# Altium project adl5960-devboard.PrjPcb
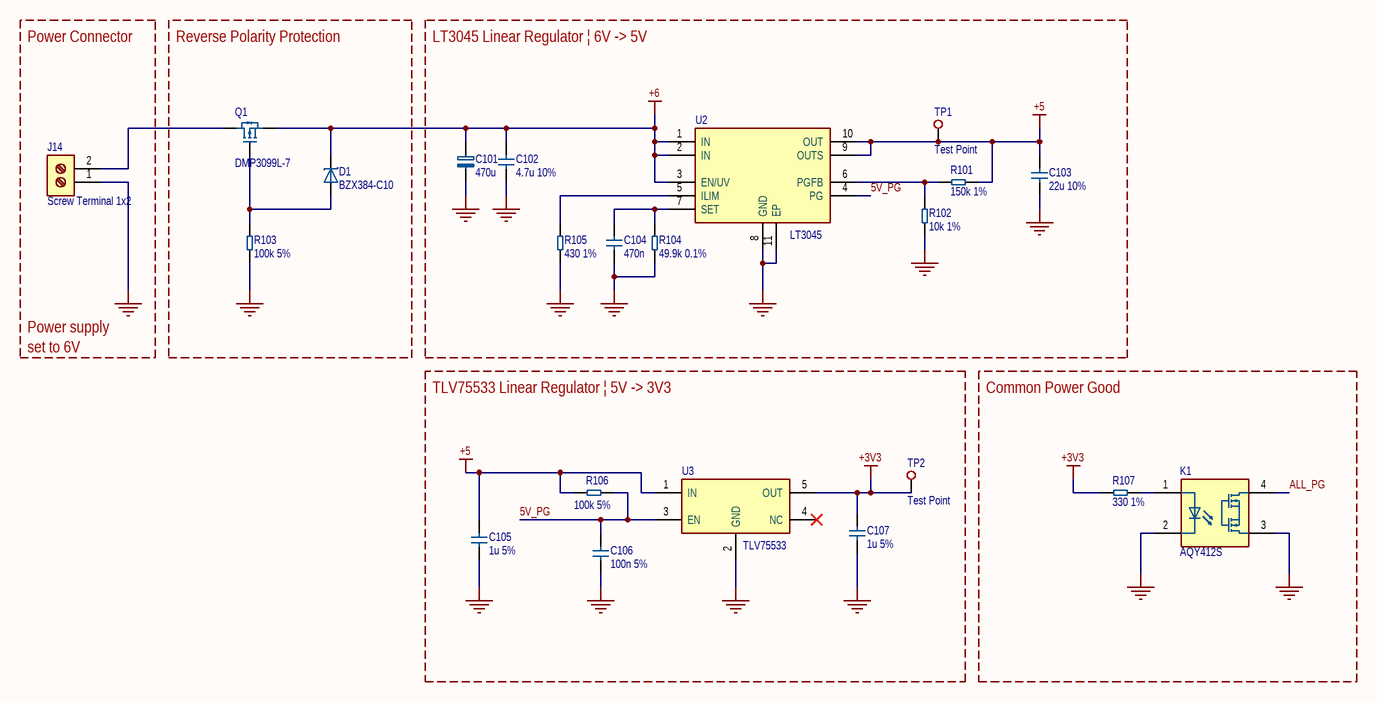
[diagram p0: adl5960-power.SchDoc]
Faculty: Wydział Elektroniki; Faculty2: i Technik Informacyjnych; ProjectAuthor: Piotr Pokornowski; ProjectCode: PP-5960DEV; ProjectRevision: A; ProjectSupervisor: Dr Inż. Maciej Urbański; ProjectTitle: ADL5960 Evalboard; ThesisType: Praca magisterska; University: Politechnika Warszawska
2 sheets, 73 parts. Net scope: global (net labels, ports and power ports of the same name join across sheets).
Board file: adl5960-devboard.PcbDoc
Sheets:
  adl5960-power.SchDoc
  adl5960-main.SchDoc

## Sheet adl5960-power.SchDoc: Zasilanie
size 420 x 297 mm; SheetNumber: 1; SheetTotal: 2; DocumentType: Schemat elektryczny

### Parts
C101  470u  [cap-ae-d10-h12.4-av]
C102  4.7u 10%  [c-0805]
C103  22u 10%  [c-1210]
C104  470n  [c-0805]
C105  1u 5%  [c-0805]
C106  100n 5%  [c-0603]
C107  1u 5%  [c-0805]
D1  BZX384-C10  [sod-323]
J14  Screw Terminal 1x2  [1715721]
K1  AQY412S  [sop-4]
Q1  DMP3099L-7  [sot-23-3-p0.95]
R101  150k 1%  [r-0603]
R102  10k 1%  [r-0603]
R103  100k 5%  [r-0603]
R104  49.9k 0.1%  [r-0603]
R105  430 1%  [r-0603]
R106  100k 5%  [r-0603]
R107  330 1%  [r-0603]
TP1  Test Point  [tp-keystone-5015]
TP2  Test Point  [tp-keystone-5015]
U2  LT3045  [LT3045HDD]
U3  TLV75533  [sot-23-5-p0.95]

### Blocks framed on the sheet
Reverse Polarity Protection: D1 Q1 R103
LT3045 Linear Regulator | 6V -> 5V: C101-C104 R101 R102 R104 R105 TP1 U2
TLV75533 Linear Regulator | 5V -> 3V3: C105-C107 R106 TP2 U3
Common Power Good: K1 R107

### Nets
+3V3: C107.2 R107.2 TP2.1 U3.5(OUT)
+5: C103.2 C105.2 R101.1 R106.2 TP1.1 U2.9(OUTS) U2.10(OUT) U3.1(IN)
+6: C101.1 C102.2 D1.1 Q1.2(S) U2.1(IN) U2.2(IN) U2.3(EN/UV)
GND: C101.2 C102.1 C103.1 C104.1 C105.1 C106.1 C107.1 J14.1 K1.2(Cathode) K1.3(Drain) R102.2 R103.1 R104.1 R105.1 U2.8(GND) U2.11(EP) U3.2(GND)
5V_PG: C106.2 R106.1 U2.4(PG) U3.3(EN)
ALL_PG: K1.4(Drain)
NetC104_2: C104.2 R104.2 U2.7(SET)
NetD1_2: D1.2 Q1.1(G) R103.2
NetJ14_2: J14.2 Q1.3(D)
NetK1_1: K1.1(Anode) R107.1
NetR101_2: R101.2 R102.1 U2.6(PGFB)
NetR105_2: R105.2 U2.5(ILIM)

Not connected (* = marked no-connect by the designer): U3 4(NC)*

### Notes on the sheet
- Power Connector
- Power supply
- set to 6V
- 1
- 2
- 3
- 4
- 5
- 6
- 7
- 8
- A
- B
- C
- D
- E
- Uczelnia
- Projekt
- Autor
- Typ dokumentu
- Promotor
- F
- Tytuł arkusza
- Numer dokumentu
- -
- Rew.
- Data
- Arkusz
- /

### Library data of the parts
C101 = Capacitor-Polar: Polarized capacitor; Manufacturer: KEMET; Manufacturer Part Number: A786MS477M1ELAV012; Voltage Rating: 25V; Tolerance: 20%; Value: 470u
C102 = Capacitor: Generic non-polarized capacitor; Manufacturer: KEMET; Manufacturer Part Number: C0805C475K4RACTU; Voltage Rating: 16V; Dielectric: X7R; Value: 4.7u; Tolerance: 10%
C103 = Capacitor: Generic non-polarized capacitor; Manufacturer: KEMET; Manufacturer Part Number: C1210C226K4RACTU; Voltage Rating: 16V; Dielectric: X7R; Value: 22u; Tolerance: 10%
C104 = Capacitor: Generic non-polarized capacitor; Manufacturer: KEMET; Manufacturer Part Number: C0805C474J4RACAUTO; Voltage Rating: 16V; Tolerance: 5%; Dielectric: X7R; Value: 470n
C105 C107 = Capacitor: Generic non-polarized capacitor; Manufacturer: KEMET; Manufacturer Part Number: C0805C105J4RAC7210; Voltage Rating: 16V; Dielectric: X7R; Value: 1u; Tolerance: 5%
C106 = Capacitor: Generic non-polarized capacitor; Manufacturer: KEMET; Manufacturer Part Number: C0603C104J4RACTU; Voltage Rating: 16V; Dielectric: X7R; Value: 100n; Tolerance: 5%
D1 = BZX384-C10,115: Diode Zener Single 10V 5% 300mW 2-Pin SOD-323 T/R; Manufacturer: Nexperia; Manufacturer Lifecycle Status: RELEASED FOR SUPPLY; Collector Emitter Breakdown Voltage: 32V; Collector Emitter Saturation Voltage: -300mV; ESD Protection: No; hFE Min: 215; Impedance: 20Ω; Max Collector Current: 100mA; Max Reverse Leakage Current: 200nA; Number of Elements: 1; Polarity: Unidirectional; Reverse Standoff Voltage: 7V; Test Current: 5mA; Supplier: RS; Supplier Part Number: 1787095; Manufacturer Part Number: BZX384-C10,115; RoHS: Compliant; Category: Zener Diodes; Stock: 23400; Case/Package: SC; China RoHS: Compliant; Composition: Zener; Contact Plating: Tin; Country of Origin: Mainland China; Export Control Classification Number (ECCN) Code: EAR99; Element Configuration: Single; Height: 1.05mm; Harmonized Tariff Schedule (HTS) Code: 8541.10.00.50; Introduction Date: 2004-03-23; Lead Free: Lead Free; Length: 1.8mm; Lifecycle Status: Production; Max Operating Temperature: 150°C; Max Power Dissipation: 300mW; Min Operating Temperature: -65°C; Mounting Technology: Surface Mount; Pins: 2; Number of Terminals: 2; Peak Reverse Current: 200nA; Power Dissipation: 300mW; Radiation Hardening: No; Ratings: AEC-Q101; REACH SVHC: Unaffected; Reference Voltage: 10V; Schedule B: 8541100050, 8541100050|8541100050|8541100050|8541100050|8541100050; Termination: SMD/SMT; Tolerance: 5%; Voltage Tolerance: 5%; Weight: 4.535924g; Width: 1.35mm; Zener Current: 5mA; Zener Voltage: 10V; ComponentLink1URL: https://datasheet.octopart.com:443/BZX384-C10%2C115-Nexperia-datasheet-8360268.pdf?src-supplier=IHS; ComponentLink1Description: https://datasheet.octopart.com:443/BZX384-C10%2C115-Nexperia-datasheet-8360268.pdf?src-supplier=IHS; ComponentLink2URL: https://datasheet.octopart.com:443/BZX384-C10%2C115-Nexperia-datasheet-155662751.pdf?src-supplier=Newark; ComponentLink2Description: https://datasheet.octopart.com:443/BZX384-C10%2C115-Nexperia-datasheet-155662751.pdf?src-supplier=Newark; ComponentLink3URL: https://datasheet.octopart.com:443/BZX384-C10%2C115-NXP-Semiconductors-datasheet-10052903.pdf?src-supplier=Newark; ComponentLink3Description: https://datasheet.octopart.com:443/BZX384-C10%2C115-NXP-Semiconductors-datasheet-10052903.pdf?src-supplier=Newark; ComponentLink4URL: https://datasheet.octopart.com:443/BZX384-C10%2C115-Nexperia-datasheet-79471522.pdf?src-supplier=LKR; ComponentLink4Description: https://datasheet.octopart.com:443/BZX384-C10%2C115-Nexperia-datasheet-79471522.pdf?src-supplier=LKR; ComponentLink5URL: https://datasheet.octopart.com:443/BZX384-C10%2C115-Nexperia-datasheet-68321567.pdf?src-supplier=element14+APAC; ComponentLink5Description: https://datasheet.octopart.com:443/BZX384-C10%2C115-Nexperia-datasheet-68321567.pdf?src-supplier=element14+APAC; ComponentLink6URL: https://datasheet.octopart.com:443/BZX384-C10%2C115-Nexperia-datasheet-105678879.pdf?src-supplier=TME; ComponentLink6Description: https://datasheet.octopart.com:443/BZX384-C10%2C115-Nexperia-datasheet-105678879.pdf?src-supplier=TME; ComponentLink7URL: https://datasheet.octopart.com:443/BZX384-C10%2C115-Nexperia-datasheet-194695641.pdf?src-supplier=HQonline; ComponentLink7Description: https://datasheet.octopart.com:443/BZX384-C10%2C115-Nexperia-datasheet-194695641.pdf?src-supplier=HQonline; ComponentLink8URL: http://sigma.octopart.com:80/reach_statement/NXP-Semiconductors-company-13.pdf?src-supplier=Compliance+Statements; ComponentLink8Description: http://sigma.octopart.com:80/reach_statement/NXP-Semiconductors-company-13.pdf?src-supplier=Compliance+Statements; ComponentLink9URL: http://sigma.octopart.com:80/rohs_statement/NXP-Semiconductors-company-12.pdf?src-supplier=Compliance+Statements; ComponentLink9Description: http://sigma.octopart.com:80/rohs_statement/NXP-Semiconductors-company-12.pdf?src-supplier=Compliance+Statements
J14 = Screw-Terminal-01x02: Terminal Block; 17.5 A; 250 V; 5.08 mm; 26 to 14 AWG; 2; Screw; Solder; 4 kV; Manufacturer: Phoenix Contact; Manufacturer Lifecycle Status: AVAILABLE; Approvals: CSA, cUL; Connector Type: PCB, Screw, Terminal Block; Current: 15A; Current Rating: 17.5A; Max Current Rating: 22A; Max Supply Voltage: 250V; Number of Circuits: 2; Number of Levels: 1; Pitch: 5.08mm; Stripping Length: 7mm; Test Voltage: 4kV; Voltage: 300V; Voltage Rating: 400V; Wire/Cable Gauge: 14AWG; Wire Gauge (Max): 26AWG; Supplier: RS; Supplier Part Number: 1930564; Manufacturer Part Number: 1715721; RoHS: Compliant; Category: Terminal Blocks; Stock: 3745; China RoHS: Compliant; Color: Green; Contact Material: Tin; Country of Origin: Germany; Depth: 9.8mm; Export Control Classification Number (ECCN) Code: EAR99; Flammability Rating: UL94 V-0; Height: 17.3mm; Housing Color: Green; Harmonized Tariff Schedule (HTS) Code: 8536.90.40.00; Insulation Material: Nylon; Introduction Date: 1998-01-15; Lead Free: Lead Free; Lead Pitch: 5.08mm; Length: 10.16mm; Lifecycle Status: Production; Max Operating Temperature: 105°C; Min Operating Temperature: -40°C; Mounting Technology: Screw; Number of Contacts: 2; Pins: 2; Number of Poles: 2; Number of Positions: 2; Number of Positions Per Level: 2; Number of Rows: 1; Orientation: Straight; Packaging: Box; Radiation Hardening: No; REACH SVHC: Unaffected; Termination: Screw; Voltage Rating (AC): 250V; Weight: 2.939987g; Width: 17.3mm; Wire Gauge (Min): 26AWG; ComponentLink1URL: https://datasheet.octopart.com:443/1715721-Phoenix-Contact-datasheet-195288929.pdf?src-supplier=Phoenix+Contact; ComponentLink1Description: https://datasheet.octopart.com:443/1715721-Phoenix-Contact-datasheet-195288929.pdf?src-supplier=Phoenix+Contact; ComponentLink2URL: https://sigma.octopart.com:443/195221700/technical_drawing/Phoenix-Contact-1715721.pdf?src-supplier=Phoenix+Contact; ComponentLink2Description: https://sigma.octopart.com:443/195221700/technical_drawing/Phoenix-Contact-1715721.pdf?src-supplier=Phoenix+Contact; ComponentLink3URL: https://datasheet.octopart.com:443/1715721-Phoenix-Contact-datasheet-62122377.pdf?src-supplier=Upverter; ComponentLink3Description: https://datasheet.octopart.com:443/1715721-Phoenix-Contact-datasheet-62122377.pdf?src-supplier=Upverter; ComponentLink4URL: https://datasheet.octopart.com:443/1715721-Phoenix-Contact-datasheet-181073212.pdf?src-supplier=IHS; ComponentLink4Description: https://datasheet.octopart.com:443/1715721-Phoenix-Contact-datasheet-181073212.pdf?src-supplier=IHS; ComponentLink5URL: https://datasheet.octopart.com:443/1715721-Phoenix-Contact-datasheet-66579234.pdf?src-supplier=Master+Electronics; ComponentLink5Description: https://datasheet.octopart.com:443/1715721-Phoenix-Contact-datasheet-66579234.pdf?src-supplier=Master+Electronics; ComponentLink6URL: https://datasheet.octopart.com:443/1715721-Phoenix-Contact-datasheet-14715205.pdf?src-supplier=Newark; ComponentLink6Description: https://datasheet.octopart.com:443/1715721-Phoenix-Contact-datasheet-14715205.pdf?src-supplier=Newark; ComponentLink7URL: https://datasheet.octopart.com:443/1715721-Phoenix-Contact-datasheet-499485.pdf?src-supplier=Newark; ComponentLink7Description: https://datasheet.octopart.com:443/1715721-Phoenix-Contact-datasheet-499485.pdf?src-supplier=Newark; ComponentLink8URL: https://datasheet.octopart.com:443/1715721-Phoenix-Contact-datasheet-154778360.pdf?src-supplier=Electro+Sonic; ComponentLink8Description: https://datasheet.octopart.com:443/1715721-Phoenix-Contact-datasheet-154778360.pdf?src-supplier=Electro+Sonic; ComponentLink9URL: https://datasheet.octopart.com:443/1715721-Phoenix-Contact-datasheet-9792235.pdf?src-supplier=TodayComponents; ComponentLink9Description: https://datasheet.octopart.com:443/1715721-Phoenix-Contact-datasheet-9792235.pdf?src-supplier=TodayComponents; ComponentLink10URL: https://datasheet.octopart.com:443/1715721-Phoenix-Contact-datasheet-166145896.pdf?src-supplier=Burklin+Elektronik; ComponentLink10Description: https://datasheet.octopart.com:443/1715721-Phoenix-Contact-datasheet-166145896.pdf?src-supplier=Burklin+Elektronik; ComponentLink11URL: https://datasheet.octopart.com:443/1715721-Phoenix-Contact-datasheet-33452854.pdf?src-supplier=MRO+Stop; ComponentLink11Description: https://datasheet.octopart.com:443/1715721-Phoenix-Contact-datasheet-33452854.pdf?src-supplier=MRO+Stop; ComponentLink12URL: https://datasheet.octopart.com:443/1715721-Phoenix-Contact-datasheet-8332660.pdf?src-supplier=Future+Electronics; ComponentLink12Description: https://datasheet.octopart.com:443/1715721-Phoenix-Contact-datasheet-8332660.pdf?src-supplier=Future+Electronics; ComponentLink13URL: https://datasheet.octopart.com:443/1715721-Phoenix-Contact-datasheet-19322.pdf?src-supplier=RS+(Formerly+Allied+Electronics); ComponentLink13Description: https://datasheet.octopart.com:443/1715721-Phoenix-Contact-datasheet-19322.pdf?src-supplier=RS+(Formerly+Allied+Electronics); ComponentLink14URL: https://datasheet.octopart.com:443/1715721-Phoenix-Contact-datasheet-84424.pdf?src-supplier=DigiKey; ComponentLink14Description: https://datasheet.octopart.com:443/1715721-Phoenix-Contact-datasheet-84424.pdf?src-supplier=DigiKey; ComponentLink15URL: http://sigma.octopart.com:80/195206437/materials_sheet/Phoenix-Contact-1715721.pdf?src-supplier=Compliance+Statements; ComponentLink15Description: http://sigma.octopart.com:80/195206437/materials_sheet/Phoenix-Contact-1715721.pdf?src-supplier=Compliance+Statements
K1 = AQY412S: RELAY OPTO 60V 0.5A SOP4 / Solid State Relay 50mA 1.5V DC-IN 0.5A 60V AC/DC-OUT 4-Pin SOP Tube; Manufacturer: Panasonic; Manufacturer Lifecycle Status: ACTIVE; Approvals: VDE, cULus; Contact Resistance: 1Ω; Current Rating: 500mA; Data Polarity: AC/DC; Forward Current: 5mA; Input Current: 900µA; Isolation Voltage: 1500Vrms; Number of Elements: 1; On-State Resistance: 2.5Ω; Value: 2.5Ω; Test Voltage: 1.5kV; Throw Configuration: SPST; Supplier: Farnell; Supplier Part Number: AQY412S; Manufacturer Part Number: AQY412S; RoHS: Compliant; Category: Solid State Relays; Stock: 46; Case/Package: SOP; Contact Plating: Tin Bismuth; Country of Origin: Japan; Export Control Classification Number (ECCN) Code: EAR99; Height: 2.1mm; Harmonized Tariff Schedule (HTS) Code: 8541.40.95.00; Introduction Date: 2005-10-06; Lead Free: Lead Free; Length: 4.4mm; Lifecycle Status: Production; Load Current: 500mA; Max Input Current: 50mA; Max Length: 4.4mm; Max Operating Temperature: 85°C; Max Output current: 500mA; Max Output Voltage: 60V; Min Operating Temperature: -40°C; Mounting Technology: Surface Mount; Pins: 4; Output Current: 500mA; Output Voltage: 60V; Packaging: Box; Radiation Hardening: No; REACH SVHC: Unaffected; Relay Type: Relay; Termination: Gull Wing; Width: 4.3mm; ComponentLink1URL: https://datasheet.octopart.com:443/AQY412S-Panasonic-datasheet-101746478.pdf?src-supplier=IHS; ComponentLink1Description: https://datasheet.octopart.com:443/AQY412S-Panasonic-datasheet-101746478.pdf?src-supplier=IHS; ComponentLink2URL: https://datasheet.octopart.com:443/AQY412S-Panasonic-datasheet-109899.pdf?src-supplier=Future+Electronics; ComponentLink2Description: https://datasheet.octopart.com:443/AQY412S-Panasonic-datasheet-109899.pdf?src-supplier=Future+Electronics; ComponentLink3URL: https://datasheet.octopart.com:443/AQY412S-Panasonic-datasheet-11045713.pdf?src-supplier=Future+Electronics; ComponentLink3Description: https://datasheet.octopart.com:443/AQY412S-Panasonic-datasheet-11045713.pdf?src-supplier=Future+Electronics; ComponentLink4URL: https://datasheet.octopart.com:443/AQY412S-Panasonic-datasheet-31679424.pdf?src-supplier=Electro+Sonic; ComponentLink4Description: https://datasheet.octopart.com:443/AQY412S-Panasonic-datasheet-31679424.pdf?src-supplier=Electro+Sonic; ComponentLink5URL: https://datasheet.octopart.com:443/AQY412S-Panasonic-datasheet-26528092.pdf?src-supplier=Electro+Sonic; ComponentLink5Description: https://datasheet.octopart.com:443/AQY412S-Panasonic-datasheet-26528092.pdf?src-supplier=Electro+Sonic; ComponentLink6URL: https://datasheet.octopart.com:443/AQY412S-Panasonic-datasheet-8857770.pdf?src-supplier=element14; ComponentLink6Description: https://datasheet.octopart.com:443/AQY412S-Panasonic-datasheet-8857770.pdf?src-supplier=element14; ComponentLink7URL: https://datasheet.octopart.com:443/AQY412S-Panasonic-datasheet-12514924.pdf?src-supplier=element14; ComponentLink7Description: https://datasheet.octopart.com:443/AQY412S-Panasonic-datasheet-12514924.pdf?src-supplier=element14; ComponentLink8URL: https://datasheet.octopart.com:443/AQY412S-Panasonic-datasheet-57363625.pdf?src-supplier=element14+APAC; ComponentLink8Description: https://datasheet.octopart.com:443/AQY412S-Panasonic-datasheet-57363625.pdf?src-supplier=element14+APAC; ComponentLink9URL: https://datasheet.octopart.com:443/AQY412S-Panasonic-datasheet-142674666.pdf?src-supplier=Master+Electronics; ComponentLink9Description: https://datasheet.octopart.com:443/AQY412S-Panasonic-datasheet-142674666.pdf?src-supplier=Master+Electronics; ComponentLink10URL: https://datasheet.octopart.com:443/AQY412S-Panasonic-datasheet-9700424.pdf?src-supplier=RS+(Formerly+Allied+Electronics); ComponentLink10Description: https://datasheet.octopart.com:443/AQY412S-Panasonic-datasheet-9700424.pdf?src-supplier=RS+(Formerly+Allied+Electronics); ComponentLink11URL: https://datasheet.octopart.com:443/AQY412S-Panasonic-datasheet-14176184.pdf?src-supplier=iiiC; ComponentLink11Description: https://datasheet.octopart.com:443/AQY412S-Panasonic-datasheet-14176184.pdf?src-supplier=iiiC
Q1 = DMP3099L-7: Transistor, MOSFET, P-Channel, 30V, 3.8A, 1.08W, SOT-23, SMD; Manufacturer: Diodes Inc.; Drain to Source Breakdown Voltage: -30V; Drain to Source Resistance: 65mΩ; Element Configuration: Single; Fall Time: 15ns; Gate to Source Voltage (Vgs): 20V; Input Capacitance: 563pF; Max Junction Temperature (Tj): 150°C; Number of Channels: 1; Rise Time: 5ns; Threshold Voltage: -2.1V; Turn-Off Delay Time: 31ns; Turn-On Delay Time: 4.8ns; Supplier: RS; Supplier Part Number: 8270503P; Manufacturer Part Number: DMP3099L-7; RoHS: Compliant; Category: MOSFETs; Stock: 444300; Case/Package: SOT-23; China RoHS: Compliant; Contact Plating: Tin; Continuous Drain Current (ID): 3.8A; Country of Origin: Mainland China; Drain to Source Voltage (Vds): -30V; Export Control Classification Number (ECCN) Code: EAR99; Height: 1.1mm; Introduction Date: 2013-05-28; Lead Free: Lead Free; Length: 3mm; Lifecycle Status: Production; Max Operating Temperature: 150°C; Max Power Dissipation: 1.08W; Min Breakdown Voltage: 30V; Min Operating Temperature: -55°C; Mounting Technology: Surface Mount; Number of Elements: 1; Pins: 3; Number of Terminals: 3; Power Dissipation: 1.08W; Radiation Hardening: No; Ratings: AEC-Q101; Rds On Max: 65mΩ; REACH SVHC: Unaffected; Schedule B: 8541290080, 8541290080|8541290080|8541290080|8541290080|8541290080; Weight: 7.994566mg; Width: 1.4mm; ComponentLink1URL: https://datasheet.octopart.com:443/DMP3099L-7-Diodes-Inc.-datasheet-171818965.pdf?src-supplier=Newark; ComponentLink1Description: https://datasheet.octopart.com:443/DMP3099L-7-Diodes-Inc.-datasheet-171818965.pdf?src-supplier=Newark; ComponentLink2URL: https://datasheet.octopart.com:443/DMP3099L-7-Diodes-Inc.-datasheet-17559051.pdf?src-supplier=Newark; ComponentLink2Description: https://datasheet.octopart.com:443/DMP3099L-7-Diodes-Inc.-datasheet-17559051.pdf?src-supplier=Newark; ComponentLink3URL: https://sigma.octopart.com:443/138706058/technical_drawing/Diodes-Inc.-DMP3099L-7.pdf?src-supplier=Diodes+Inc+SCT; ComponentLink3Description: https://sigma.octopart.com:443/138706058/technical_drawing/Diodes-Inc.-DMP3099L-7.pdf?src-supplier=Diodes+Inc+SCT
R101 = Resistor: Generic resistor; Manufacturer: YAGEO; Manufacturer Part Number: AC0603FR-07150KL; Power Rating: 100mW; Value: 150k; Tolerance: 1%
R102 = Resistor: Generic resistor; Manufacturer: YAGEO; Manufacturer Part Number: AC0603FRE0710KL; Power Rating: 100mW; Value: 10k; Tolerance: 1%
R103 R106 = Resistor: Generic resistor; Manufacturer: YAGEO; Manufacturer Part Number: AC0603JR-07100KL; Power Rating: 100mW; Value: 100k; Tolerance: 5%
R104 = Resistor: Generic resistor; Manufacturer: YAGEO; Manufacturer Part Number: AT0603BRD0749K9L; Power Rating: 100mW; Value: 49.9k; Tolerance: 0.1%
R105 = Resistor: Generic resistor; Manufacturer: YAGEO; Manufacturer Part Number: AC0603FR-07430RL; Value: 430; Power Rating: 100mW; Tolerance: 1%
R107 = Resistor: Generic resistor; Manufacturer: YAGEO; Manufacturer Part Number: AC0603FR-07330RL; Value: 330; Power Rating: 100mW; Tolerance: 1%
TP1 TP2 = TestPoint
U2 = LT3045HDD: Manufacturer: Analog Devices; Manufacturer Lifecycle Status: PRODUCTION; Manufacturer Part Number: LT3045HDD#TRPBF; Case/Package: DFN; Category: LDO Voltage Regulators; Lifecycle Status: Production; Pins: 10; RoHS: Compliant
U3 = TLV75533PDBVR: 500mA high-PSRR low-IQ low-dropout voltage regulator with enable 5-SOT-23 -40 to 125; Manufacturer: Texas Instruments; Manufacturer Lifecycle Status: ACTIVE; Accuracy: 1%; Dropout Voltage: 150mV; Max Junction Temperature (Tj): 125°C; Max Supply Voltage: 5.5V; Min Supply Voltage: 1.45V; Number of Channels: 1; Output Voltage: 3.3V; Supplier: Mouser; Supplier Part Number: 595-TLV75533PDBVR; Manufacturer Part Number: TLV75533PDBVR; RoHS: Compliant; Category: LDO Voltage Regulators; Pricing: 1=0.42, 10=0.293, 50=0.262, 100=0.226, 1000=0.191, 10000=0.175 (USD); Ambient Temperature Range High: 70°C; Case/Package: SOT-23; Height: 1.45mm; Length: 2.9mm; Lifecycle Status: Production; Max Operating Temperature: 125°C; Min Operating Temperature: -40°C; Number of Outputs: 1; Pins: 5; Output Current: 500mA; Schedule B: 8542390000; Thickness: 1.2mm; Width: 1.6mm; ComponentLink1URL: https://sigma.octopart.com:443/177332311/technical_drawing/Texas-Instruments-TLV75533PDBVR.pdf?src-supplier=Texas+Instruments; ComponentLink1Description: https://sigma.octopart.com:443/177332311/technical_drawing/Texas-Instruments-TLV75533PDBVR.pdf?src-supplier=Texas+Instruments; ComponentLink2URL: https://octopart.com:443/opatz8j6/c1?t=OF4MY8j2GA053KXj_Rbi0lwcRoOaeC9vdUWQTlFE7L30B59HVjSj8orL1cO7i2UbJ9jLCuoxIIGp2turddIIp3WU7w4ILCIJQAdNHCr4Uz2XRSgoeoBnimB_7HG8tHaXeIQTPep1GQnTFNbHhkWVJJHBreV00-L0n-dDLSyLNgnSOYK5ptxy90HGUV8QmDiVKz2oakT4HfE98kP1BLs3kDyqsBGBGrhBwGMh32VdvwUpTsSrcOQpS_Uw1BfDnwhI3k9BdSneUSAtzrf09OPWFRnetYmhuydrape5EZwG80Fvpz037shPIUgx6ap4yn0eXGFYYe_7s1apKPt28Ei4Gc1NGcwNhnhkvN9aMFvs1F_KimyCvgN9K29ugjhLTEgeGLjTJw&src-supplier=Texas+Instruments; ComponentLink2Description: https://octopart.com:443/opatz8j6/c1?t=OF4MY8j2GA053KXj_Rbi0lwcRoOaeC9vdUWQTlFE7L30B59HVjSj8orL1cO7i2UbJ9jLCuoxIIGp2turddIIp3WU7w4ILCIJQAdNHCr4Uz2XRSgoeoBnimB_7HG8tHaXeIQTPep1GQnTFNbHhkWVJJHBreV00-L0n-dDLSyLNgnSOYK5ptxy90HGUV8QmDiVKz2oakT4HfE98kP1BLs3kDyqsBGBGrhBwGMh32VdvwUpTsSrcOQpS_Uw1BfDnwhI3k9BdSneUSAtzrf09OPWFRnetYmhuydrape5EZwG80Fvpz037shPIUgx6ap4yn0eXGFYYe_7s1apKPt28Ei4Gc1NGcwNhnhkvN9aMFvs1F_KimyCvgN9K29ugjhLTEgeGLjTJw&src-supplier=Texas+Instruments; ComponentLink3URL: https://sigma.octopart.com:443/175570406/technical_drawing/Texas-Instruments-TLV75533PDBVR.pdf?src-supplier=Texas+Instruments; ComponentLink3Description: https://sigma.octopart.com:443/175570406/technical_drawing/Texas-Instruments-TLV75533PDBVR.pdf?src-supplier=Texas+Instruments; ComponentLink4URL: https://sigma.octopart.com:443/169406034/technical_drawing/Texas-Instruments-TLV75533PDBVR.pdf?src-supplier=Texas+Instruments; ComponentLink4Description: https://sigma.octopart.com:443/169406034/technical_drawing/Texas-Instruments-TLV75533PDBVR.pdf?src-supplier=Texas+Instruments; ComponentLink5URL: https://sigma.octopart.com:443/155939316/technical_drawing/Texas-Instruments-TLV75533PDBVR.pdf?src-supplier=Texas+Instruments; ComponentLink5Description: https://sigma.octopart.com:443/155939316/technical_drawing/Texas-Instruments-TLV75533PDBVR.pdf?src-supplier=Texas+Instruments; ComponentLink6URL: https://sigma.octopart.com:443/102331370/technical_drawing/Texas-Instruments-TLV75533PDBVR.pdf?src-supplier=Texas+Instruments; ComponentLink6Description: https://sigma.octopart.com:443/102331370/technical_drawing/Texas-Instruments-TLV75533PDBVR.pdf?src-supplier=Texas+Instruments; ComponentLink7URL: https://datasheet.octopart.com:443/TLV75533PDBVR-Texas-Instruments-datasheet-150455022.pdf?src-supplier=Augswan; ComponentLink7Description: https://datasheet.octopart.com:443/TLV75533PDBVR-Texas-Instruments-datasheet-150455022.pdf?src-supplier=Augswan; ComponentLink8URL: https://datasheet.octopart.com:443/TLV75533PDBVR-Texas-Instruments-datasheet-165804640.pdf?src-supplier=LCSC; ComponentLink8Description: https://datasheet.octopart.com:443/TLV75533PDBVR-Texas-Instruments-datasheet-165804640.pdf?src-supplier=LCSC; ComponentLink9URL: https://datasheet.octopart.com:443/TLV75533PDBVR-Texas-Instruments-datasheet-159117836.pdf?src-supplier=LCSC; ComponentLink9Description: https://datasheet.octopart.com:443/TLV75533PDBVR-Texas-Instruments-datasheet-159117836.pdf?src-supplier=LCSC; ComponentLink10URL: http://sigma.octopart.com:80/reach_statement/Texas-Instruments-company-64.pdf?src-supplier=Compliance+Statements; ComponentLink10Description: http://sigma.octopart.com:80/reach_statement/Texas-Instruments-company-64.pdf?src-supplier=Compliance+Statements; ComponentLink11URL: http://sigma.octopart.com:80/conflict_mineral_statement/Texas-Instruments-company-63.pdf?src-supplier=Compliance+Statements; ComponentLink11Description: http://sigma.octopart.com:80/conflict_mineral_statement/Texas-Instruments-company-63.pdf?src-supplier=Compliance+Statements

## Sheet adl5960-main.SchDoc: ADL5960 + Sterowanie
size 420 x 297 mm; SheetNumber: 2; SheetTotal: 2; DocumentType: Schemat elektryczny
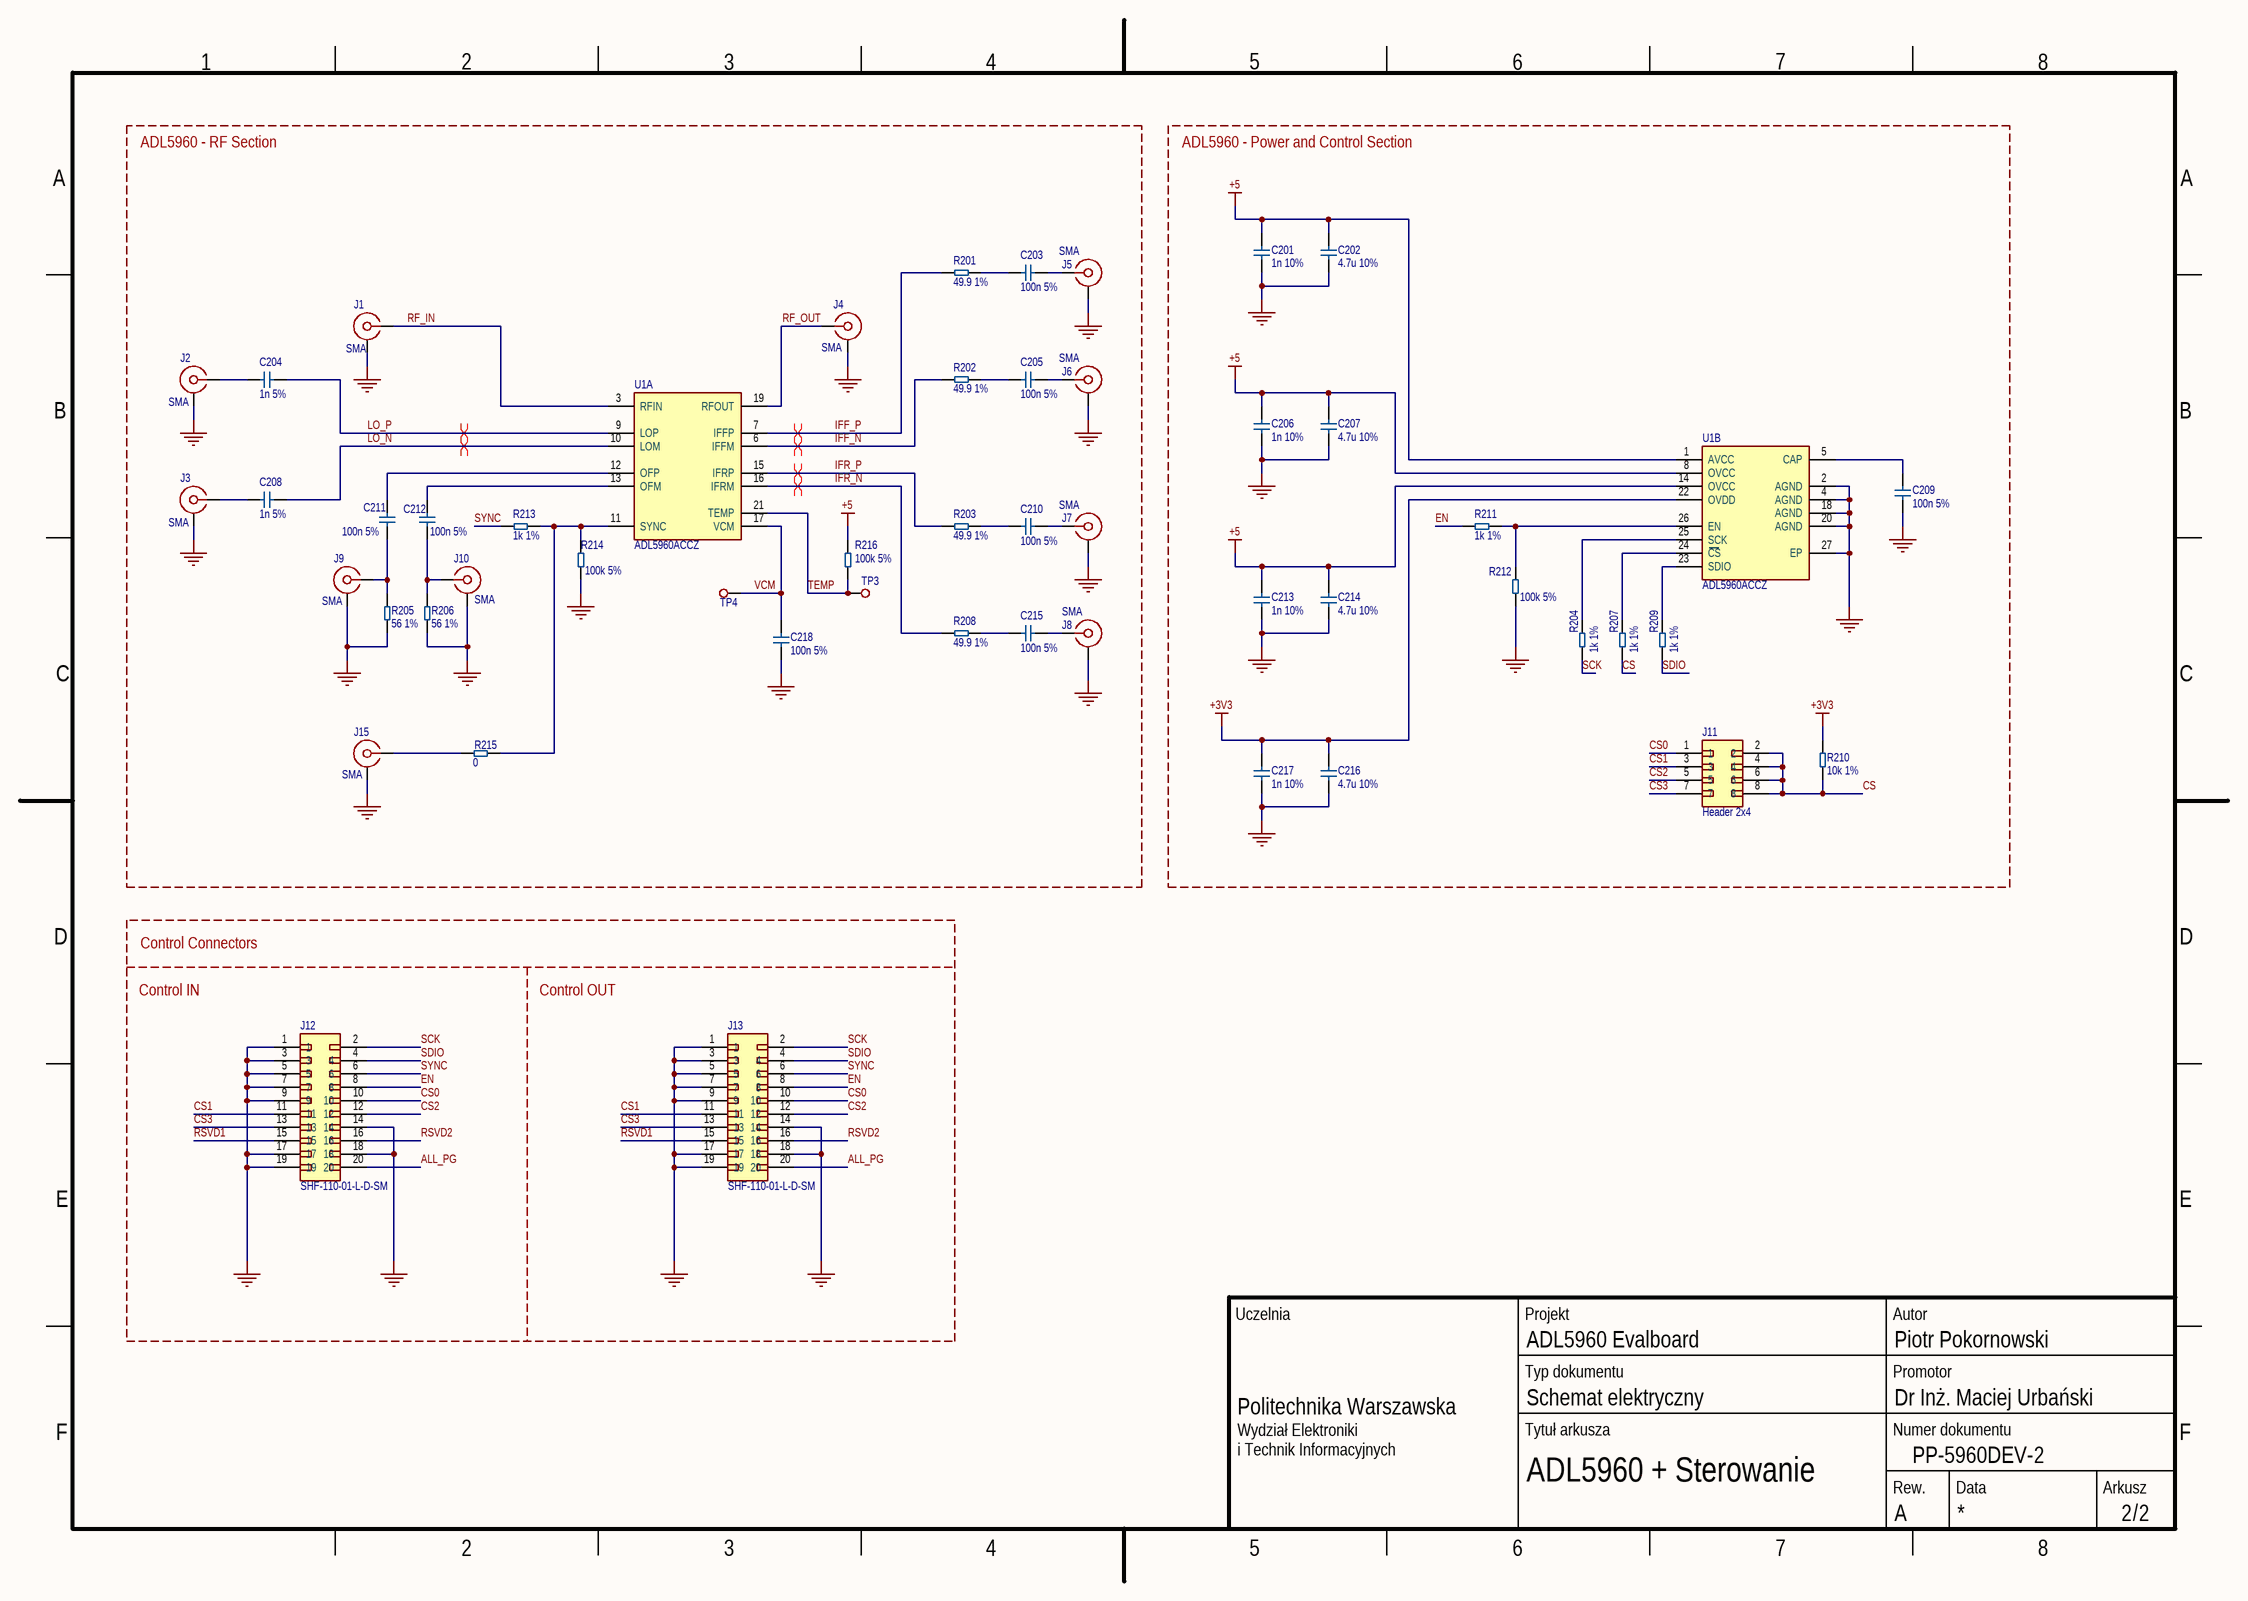
[diagram p1: adl5960-main.SchDoc]

### Parts
C201  1n 10%  [c-0402]
C202  4.7u 10%  [c-0805]
C203  100n 5%  [c-0603]
C204  1n 5%  [c-0402]
C205  100n 5%  [c-0603]
C206  1n 10%  [c-0402]
C207  4.7u 10%  [c-0805]
C208  1n 5%  [c-0402]
C209  100n 5%  [c-0603]
C210  100n 5%  [c-0603]
C211  100n 5%  [c-0603]
C212  100n 5%  [c-0603]
C213  1n 10%  [c-0402]
C214  4.7u 10%  [c-0805]
C215  100n 5%  [c-0603]
C216  4.7u 10%  [c-0805]
C217  1n 10%  [c-0402]
C218  100n 5%  [c-0603]
J1  SMA  [32K243-40ML5]
J2  SMA  [32K243-40ML5]
J3  SMA  [32K243-40ML5]
J4  SMA  [32K243-40ML5]
J5  SMA  [32K243-40ML5]
J6  SMA  [32K243-40ML5]
J7  SMA  [32K243-40ML5]
J8  SMA  [32K243-40ML5]
J9  SMA  [32K243-40ML5]
J10  SMA  [32K243-40ML5]
J11  Header 2x4  [Header-2x4-THT-P2.54]
J12  SHF-110-01-L-D-SM  [SHF-110-01-L-D-SM]
J13  SHF-110-01-L-D-SM  [SHF-110-01-L-D-SM]
J15  SMA  [32K243-40ML5]
R201  49.9 1%  [r-0603]
R202  49.9 1%  [r-0603]
R203  49.9 1%  [r-0603]
R204  1k 1%  [r-0603]
R205  56 1%  [r-0603]
R206  56 1%  [r-0603]
R207  1k 1%  [r-0603]
R208  49.9 1%  [r-0603]
R209  1k 1%  [r-0603]
R210  10k 1%  [r-0603]
R211  1k 1%  [r-0603]
R212  100k 5%  [r-0603]
R213  1k 1%  [r-0603]
R214  100k 5%  [r-0603]
R215  0  [r-0603]
R216  100k 5%  [r-0603]
TP3  Test Point  [tp-keystone-5015]  (value not drawn)
TP4  Test Point  [tp-keystone-5015]  (value not drawn)
U1  ADL5960ACCZ  [ADL5960ACCZ]  (parts A,B of 2)

### Blocks framed on the sheet
ADL5960 - RF Section: C203-C205 C208 C210-C212 C215 C218 J1-J10 J15 R201-R203 R205 R206 R208 R213-R216 TP3 TP4 U1
ADL5960 - Power and Control Section: C201 C202 C206 C207 C209 C213 C214 C216 C217 J11 R204 R207 R209-R212 U1

### Nets
+3V3: C216.2 C217.1 R210.1 U1.22(OVDD)
+5: C201.1 C202.2 C206.1 C207.2 C213.1 C214.2 R216.2 U1.1(AVCC) U1.8(OVCC) U1.14(OVCC)
GND: C201.2 C202.1 C206.2 C207.1 C209.1 C213.2 C214.1 C216.1 C217.2 C218.1 J1.2 J2.2 J3.2 J4.2 J5.2 J6.2 J7.2 J8.2 J9.2 J10.2 J12.1 J12.3 J12.5 J12.7 J12.9 J12.14 J12.17 J12.18 J12.19 J13.1 J13.3 J13.5 J13.7 J13.9 J13.14 J13.17 J13.18 J13.19 J15.2 R205.1 R206.1 R212.1 R214.1 U1.2(AGND) U1.4(AGND) U1.18(AGND) U1.20(AGND) U1.27(EP)
ALL_PG: J12.20 J13.20
CS: J11.2 J11.4 J11.6 J11.8 R207.2 R210.2
CS0: J11.1 J12.10 J13.10
CS1: J11.3 J12.11 J13.11
CS2: J11.5 J12.12 J13.12
CS3: J11.7 J12.13 J13.13
EN: J12.8 J13.8 R211.1
IFF_N: R202.2 U1.6(IFFM)
IFF_P: R201.2 U1.7(IFFP)
IFR_N: R208.2 U1.16(IFRM)
IFR_P: R203.2 U1.15(IFRP)
LO_N: C208.2 U1.10(LOM)
LO_P: C204.2 U1.9(LOP)
RF_IN: J1.1 U1.3(RFIN)
RF_OUT: J4.1 U1.19(RFOUT)
RSVD1: J12.15 J13.15
RSVD2: J12.16 J13.16
SCK: J12.2 J13.2 R204.2
SDIO: J12.4 J13.4 R209.2
SYNC: J12.6 J13.6 R213.1
TEMP: R216.1 TP3.1 U1.21(TEMP)
VCM: C218.2 TP4.1 U1.17(VCM)
NetC203_1: C203.1 R201.1
NetC203_2: C203.2 J5.1
NetC204_1: C204.1 J2.1
NetC205_1: C205.1 R202.1
NetC205_2: C205.2 J6.1
NetC208_1: C208.1 J3.1
NetC209_2: C209.2 U1.5(CAP)
NetC210_1: C210.1 R203.1
NetC210_2: C210.2 J7.1
NetC211_1: C211.1 J9.1 R205.2
NetC211_2: C211.2 U1.12(OFP)
NetC212_1: C212.1 J10.1 R206.2
NetC212_2: C212.2 U1.13(OFM)
NetC215_1: C215.1 R208.1
NetC215_2: C215.2 J8.1
NetJ15_1: J15.1 R215.1
NetR204_1: R204.1 U1.25(SCK)
NetR207_1: R207.1 U1.24(CS)
NetR209_1: R209.1 U1.23(SDIO)
NetR211_2: R211.2 R212.2 U1.26(EN)
NetR213_2: R213.2 R214.2 R215.2 U1.11(SYNC)

### Layout directives
differential pair: IFF_N, IFF_P, IFR_N, IFR_P, LO_N, LO_P

### Notes on the sheet
- 1
- 2
- 3
- 4
- 5
- 6
- 7
- 8
- A
- B
- C
- D
- Control IN
- Control Connectors
- Control OUT
- E
- Uczelnia
- Projekt
- Autor
- Typ dokumentu
- Promotor
- F
- Tytuł arkusza
- Numer dokumentu
- -
- Rew.
- Data
- Arkusz
- /

### Library data of the parts
C201 C206 C213 C217 = capacitor: Generic non-polarized capacitor; Manufacturer: KEMET; Manufacturer Part Number: C0402C102K8GACTU; Voltage Rating: 10V; Dielectric: C0G; Value: 1n; Tolerance: 10%
C202 C207 C214 C216 = Capacitor: as C102 on sheet adl5960-power; Value: 4.7u; Tolerance: 10%
C203 C205 C209-C212 C215 C218 = Capacitor: as C106 on sheet adl5960-power; Value: 100n; Tolerance: 5%
C204 C208 = Capacitor: Generic non-polarized capacitor; Manufacturer: KEMET; Manufacturer Part Number: C0402C102J4GACTU; Voltage Rating: 16V; Dielectric: C0G; Value: 1n; Tolerance: 5%
J1-J10 J15 = 32K243-40ML5: Rf Coaxial Connector, 50 Ohm, In-series, Sma Right Angle Jack Pcb, Sma Series; Manufacturer: Rosenberger; Contact Resistance: 3mΩ; Contact Style: Coax; Dielectric Material: PTFE; Frequency: 18GHz; Gender: Female; Impedance: 50Ω; Insertion Loss (dB): 0.17dB; Insulation Resistance: 5GΩ; Number of Contacts: 1; Voltage Rating: 480V; Supplier: Mouser; Supplier Part Number: 476-32K243-40ML5; Manufacturer Part Number: 32K243-40ML5; RoHS: Compliant; Category: RF / Coaxial Connectors; Stock: 5444; Pricing: 1=20.21, 10=17.36, 50=15.71, 100=14.66, 1000=13.36, 10000=13.36 (USD); Ambient Temperature Range High: 165°C; Case/Package: SMA; China RoHS: Non-Compliant; Contact Material: Gold; Contact Plating: Gold; Export Control Classification Number (ECCN) Code: EAR99; Fastening Type: Threaded; Harmonized Tariff Schedule (HTS) Code: 8536.69.40.10; Introduction Date: 2007-04-18; Lifecycle Status: Production; Max Operating Temperature: 165°C; Manufacturer Package Identifier: 32K243-40ML5; Min Operating Temperature: -65°C; Number of Ports: 1; Number of Positions: 1; Orientation: Right Angle; REACH SVHC: Affected; ComponentLink1URL: https://sigma.octopart.com:443/138897775/technical_drawing/Rosenberger-32K243-40ML5.pdf?src-supplier=Upverter; ComponentLink1Description: https://sigma.octopart.com:443/138897775/technical_drawing/Rosenberger-32K243-40ML5.pdf?src-supplier=Upverter; ComponentLink2URL: https://datasheet.octopart.com:443/32K243-40ML5-Rosenberger-datasheet-136490776.pdf?src-supplier=Upverter; ComponentLink2Description: https://datasheet.octopart.com:443/32K243-40ML5-Rosenberger-datasheet-136490776.pdf?src-supplier=Upverter; ComponentLink3URL: https://datasheet.octopart.com:443/32K243-40ML5-Rosenberger-datasheet-181232220.pdf?src-supplier=IHS; ComponentLink3Description: https://datasheet.octopart.com:443/32K243-40ML5-Rosenberger-datasheet-181232220.pdf?src-supplier=IHS; ComponentLink4URL: https://datasheet.octopart.com:443/32K243-40ML5-Rosenberger-datasheet-154574681.pdf?src-supplier=RS+(Formerly+Allied+Electronics); ComponentLink4Description: https://datasheet.octopart.com:443/32K243-40ML5-Rosenberger-datasheet-154574681.pdf?src-supplier=RS+(Formerly+Allied+Electronics); Supplier 1: Mouser; Supplier Part Number 1: 476-32K243-40ML5
J11 = Header-2x4: Dual-row, 8-pin connector; Manufacturer: Samtec; Manufacturer Part Number: TSW-104-07-G-D
J12 J13 = SHF-110-01-L-D-SM: Pin Header, Wire-to-Board, 1.27 mm, 2 Rows, 20 Contacts, Surface Mount, SHF Series; Manufacturer: Samtec; Manufacturer Lifecycle Status: PRODUCTION; Gender: Male; Max Current Rating: 3A; Number of Contacts: 20; Pitch: 1.27mm; Supplier: RS; Supplier Part Number: 9011876; Manufacturer Part Number: SHF-110-01-L-D-SM; RoHS: Compliant; Category: Headers and Wire Housings; Stock: 708; Contact Material: Bronze; Contact Plating: Gold; Depth: 5.59mm; Housing Color: Black; Housing Material: Polymer; Length: 19.05mm; Lifecycle Status: Production; Max Operating Temperature: 125°C; Min Operating Temperature: -55°C; Pins: 20; Number of Rows: 2; Orientation: Straight; Radiation Hardening: No; REACH SVHC: Unaffected; Termination: Solder; ComponentLink1URL: https://sigma.octopart.com:443/97277425/technical_drawing/Samtec-SHF-110-01-L-D-SM.pdf?src-supplier=Samtec; ComponentLink1Description: https://sigma.octopart.com:443/97277425/technical_drawing/Samtec-SHF-110-01-L-D-SM.pdf?src-supplier=Samtec; ComponentLink2URL: https://datasheet.octopart.com:443/SHF-110-01-L-D-SM-Samtec-datasheet-96974960.pdf?src-supplier=Samtec; ComponentLink2Description: https://datasheet.octopart.com:443/SHF-110-01-L-D-SM-Samtec-datasheet-96974960.pdf?src-supplier=Samtec; ComponentLink3URL: https://datasheet.octopart.com:443/SHF-110-01-L-D-SM-Samtec-datasheet-118492834.pdf?src-supplier=Sager+Electronics; ComponentLink3Description: https://datasheet.octopart.com:443/SHF-110-01-L-D-SM-Samtec-datasheet-118492834.pdf?src-supplier=Sager+Electronics; ComponentLink4URL: https://datasheet.octopart.com:443/SHF-110-01-L-D-SM-Samtec-datasheet-154853690.pdf?src-supplier=Sager+Electronics; ComponentLink4Description: https://datasheet.octopart.com:443/SHF-110-01-L-D-SM-Samtec-datasheet-154853690.pdf?src-supplier=Sager+Electronics; ComponentLink5URL: https://datasheet.octopart.com:443/SHF-110-01-L-D-SM-Samtec-datasheet-41643068.pdf?src-supplier=Newark; ComponentLink5Description: https://datasheet.octopart.com:443/SHF-110-01-L-D-SM-Samtec-datasheet-41643068.pdf?src-supplier=Newark; ComponentLink6URL: https://datasheet.octopart.com:443/SHF-110-01-L-D-SM-Samtec-datasheet-14716432.pdf?src-supplier=Newark; ComponentLink6Description: https://datasheet.octopart.com:443/SHF-110-01-L-D-SM-Samtec-datasheet-14716432.pdf?src-supplier=Newark; ComponentLink7URL: https://datasheet.octopart.com:443/SHF-110-01-L-D-SM-Samtec-datasheet-63880525.pdf?src-supplier=Newark; ComponentLink7Description: https://datasheet.octopart.com:443/SHF-110-01-L-D-SM-Samtec-datasheet-63880525.pdf?src-supplier=Newark; ComponentLink8URL: https://datasheet.octopart.com:443/SHF-110-01-L-D-SM-Samtec-datasheet-21214285.pdf?src-supplier=Newark; ComponentLink8Description: https://datasheet.octopart.com:443/SHF-110-01-L-D-SM-Samtec-datasheet-21214285.pdf?src-supplier=Newark; ComponentLink9URL: https://datasheet.octopart.com:443/SHF-110-01-L-D-SM-Samtec-datasheet-118892784.pdf?src-supplier=Master+Electronics; ComponentLink9Description: https://datasheet.octopart.com:443/SHF-110-01-L-D-SM-Samtec-datasheet-118892784.pdf?src-supplier=Master+Electronics; ComponentLink10URL: https://datasheet.octopart.com:443/SHF-110-01-L-D-SM-Samtec-datasheet-116534221.pdf?src-supplier=Toby+Electronics; ComponentLink10Description: https://datasheet.octopart.com:443/SHF-110-01-L-D-SM-Samtec-datasheet-116534221.pdf?src-supplier=Toby+Electronics; ComponentLink11URL: https://datasheet.octopart.com:443/SHF-110-01-L-D-SM-Samtec-datasheet-116536228.pdf?src-supplier=Toby+Electronics; ComponentLink11Description: https://datasheet.octopart.com:443/SHF-110-01-L-D-SM-Samtec-datasheet-116536228.pdf?src-supplier=Toby+Electronics; ComponentLink12URL: https://datasheet.octopart.com:443/SHF-110-01-L-D-SM-Samtec-datasheet-14716430.pdf?src-supplier=Farnell; ComponentLink12Description: https://datasheet.octopart.com:443/SHF-110-01-L-D-SM-Samtec-datasheet-14716430.pdf?src-supplier=Farnell
R201-R203 R208 = Resistor: Generic resistor; Manufacturer: YAGEO; Manufacturer Part Number: AC0603FR-0749R9L; Value: 49.9; Power Rating: 100mW; Tolerance: 1%
R204 R207 R209 R211 R213 = Resistor: Generic resistor; Manufacturer: YAGEO; Manufacturer Part Number: AC0603FR-071KL; Power Rating: 100mW; Value: 1k; Tolerance: 1%
R205 R206 = Resistor: Generic resistor; Manufacturer: YAGEO; Manufacturer Part Number: AC0603FR-0756RL; Value: 56; Power Rating: 100mW; Tolerance: 1%
R210 = Resistor: as R102 on sheet adl5960-power; Value: 10k; Tolerance: 1%
R212 R214 R216 = Resistor: as R103 on sheet adl5960-power; Value: 100k; Tolerance: 5%
R215 = Resistor: Manufacturer: YAGEO; Manufacturer Part Number: AC0603FR-070RL; Power Rating: 100mW; Value: 0
TP3 TP4 = TestPoint
U1 = ADL5960ACCZ: 10 MHz to 20 GHz Integrated Vector Network Analyzer Front End; Manufacturer: Analog Devices; Manufacturer Lifecycle Status: PRODUCTION; Supplier: Farnell; Supplier Part Number: ADL5960ACCZ; Manufacturer Part Number: ADL5960ACCZ; Category: Uncategorized; Stock: 30; Lifecycle Status: Production; ComponentLink1URL: https://octopart.com:443/opatz8j6/c1?t=sNn__E9if7phYpKIGt1HGors_3fkiZxAOk72fyHCpcdGdEVv4rI4oJjph59vRY8RkB2W6v6FUDb5vdq2LBbZOBejgV7lxPf1byVkt5o1bTHGBtKKZ6Tb3MUQ4F5jve5jIWWR5DzlCFF3u66MTO-qwqQC24WdVR_dh-itx28DAXgluqoEWVUgxFMfBbjVdfTk_KnL56IoFFq5EsB3mzvz68whwf5lUIDgQKXuAkuEH9EekJ4yxnZRnlukBpMqeuNE75q6lyql7jt9fMK9L5vifS7jSQ0phH-iyEfXCpMlEKgYs4T2ZLlJAKc&src-supplier=Analog+Devices; ComponentLink1Description: https://octopart.com:443/opatz8j6/c1?t=sNn__E9if7phYpKIGt1HGors_3fkiZxAOk72fyHCpcdGdEVv4rI4oJjph59vRY8RkB2W6v6FUDb5vdq2LBbZOBejgV7lxPf1byVkt5o1bTHGBtKKZ6Tb3MUQ4F5jve5jIWWR5DzlCFF3u66MTO-qwqQC24WdVR_dh-itx28DAXgluqoEWVUgxFMfBbjVdfTk_KnL56IoFFq5EsB3mzvz68whwf5lUIDgQKXuAkuEH9EekJ4yxnZRnlukBpMqeuNE75q6lyql7jt9fMK9L5vifS7jSQ0phH-iyEfXCpMlEKgYs4T2ZLlJAKc&src-supplier=Analog+Devices; ComponentLink2URL: http://sigma.octopart.com:80/conflict_mineral_statement/Analog-Devices-company-33.pdf?src-supplier=Compliance+Statements; ComponentLink2Description: http://sigma.octopart.com:80/conflict_mineral_statement/Analog-Devices-company-33.pdf?src-supplier=Compliance+Statements; ComponentLink3URL: https://octopart.com:443/opatz8j6/c1?t=wHYJiqXauK4GQM2tQ_zDqUa69f3N-5zA8TKZKGG1nxLidXH63u1cM0l-QN9E_93qqH5iv-1ZwJaGS180fzg_5Oe7Zc70L6wz2jI3y8w5lOGbgZyt_6NHhOm9jFHXaC4goDV5tsi3ZeeHrBwAQ6jdg7bzlT8NTI2okqPMewkI4fW6NGQpSGyHBCKZ0RyHdS3IP7gHGcc2ag_P3vSw00v3vkIXauamRiOkOWDHR5I_2w_ejY6bXPncjy1qH_sL9J1lP9Udtz3B5do7UwqucEogziSC9qVfJGWqMtIPTtJ4546mLJoeyxvlv0E&src-supplier=Compliance+Statements; ComponentLink3Description: https://octopart.com:443/opatz8j6/c1?t=wHYJiqXauK4GQM2tQ_zDqUa69f3N-5zA8TKZKGG1nxLidXH63u1cM0l-QN9E_93qqH5iv-1ZwJaGS180fzg_5Oe7Zc70L6wz2jI3y8w5lOGbgZyt_6NHhOm9jFHXaC4goDV5tsi3ZeeHrBwAQ6jdg7bzlT8NTI2okqPMewkI4fW6NGQpSGyHBCKZ0RyHdS3IP7gHGcc2ag_P3vSw00v3vkIXauamRiOkOWDHR5I_2w_ejY6bXPncjy1qH_sL9J1lP9Udtz3B5do7UwqucEogziSC9qVfJGWqMtIPTtJ4546mLJoeyxvlv0E&src-supplier=Compliance+Statements; Supplier 1: Farnell; Supplier Part Number 1: ADL5960ACCZ

## Nets that join several sheets
+3V3: adl5960-power (C107.2 R107.2 TP2.1 U3.5), adl5960-main (C216.2 C217.1 R210.1 U1.22)
+5: adl5960-power (8 pins), adl5960-main (10 pins)
GND: adl5960-power (17 pins), adl5960-main (48 pins)
ALL_PG: adl5960-power (K1.4), adl5960-main (J12.20 J13.20)

## Assembly variants
STD: not fitted J15 R215
SYNC_SMA: not fitted R213